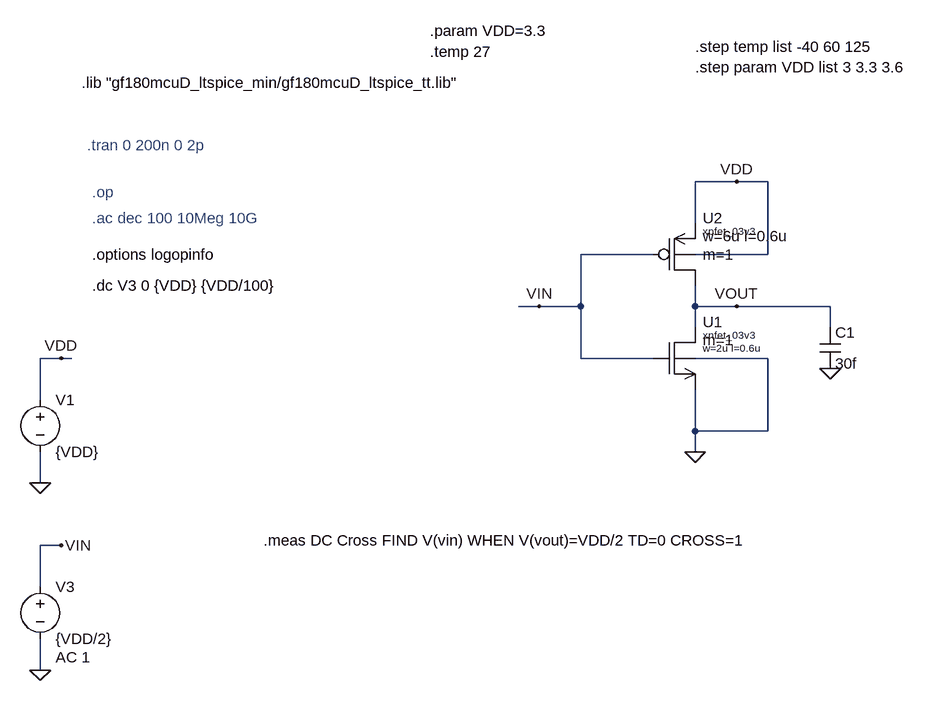
[diagram p0: schematic inv_dc_PVT.asc]
inv_dc_PVT.asc, the LTspice schematic file:
Version 4.1
SHEET 1 6080 1492
WIRE 1120 -320 1056 -320
WIRE 1168 -320 1120 -320
WIRE 1056 -256 1056 -320
WIRE 992 -208 880 -208
WIRE 1168 -208 1168 -320
WIRE 1168 -208 1056 -208
WIRE 816 -128 784 -128
WIRE 880 -128 880 -208
WIRE 880 -128 816 -128
WIRE 1056 -128 1056 -160
WIRE 1120 -128 1056 -128
WIRE 1264 -128 1120 -128
WIRE 1056 -96 1056 -128
WIRE 1264 -96 1264 -128
WIRE 80 -48 48 -48
WIRE 96 -48 80 -48
WIRE 880 -48 880 -128
WIRE 992 -48 880 -48
WIRE 1168 -48 1056 -48
WIRE 48 16 48 -48
WIRE 1056 64 1056 0
WIRE 1168 64 1168 -48
WIRE 1168 64 1056 64
WIRE 1056 96 1056 64
WIRE 48 144 48 96
WIRE 80 240 48 240
WIRE 48 304 48 240
WIRE 48 432 48 384
FLAG 80 -48 VDD
FLAG 48 144 0
FLAG 1120 -320 VDD
FLAG 1056 96 0
FLAG 80 240 VIN
FLAG 48 432 0
FLAG 1120 -128 VOUT
FLAG 816 -128 VIN
FLAG 1264 -32 0
SYMBOL voltage 48 0 R0
WINDOW 123 0 0 Left 0
WINDOW 39 0 0 Left 0
SYMATTR InstName V1
SYMATTR Value {VDD}
SYMBOL xnch 1008 -96 R0
WINDOW 123 60 20 Left 2
SYMATTR Value2 m=1
SYMATTR InstName U1
SYMATTR Value w=2u l=0.6u
SYMATTR SpiceModel xnfet_03v3
SYMBOL xpch 1008 -256 R0
WINDOW 3 60 20 Left 2
WINDOW 123 60 48 Left 2
SYMATTR Value w=6u l=0.6u
SYMATTR Value2 m=1
SYMATTR InstName U2
SYMATTR SpiceModel xpfet_03v3
SYMBOL voltage 48 288 R0
WINDOW 123 24 124 Left 2
WINDOW 39 0 0 Left 0
SYMATTR Value2 AC 1
SYMATTR InstName V3
SYMATTR Value {VDD/2}
SYMBOL cap 1248 -96 R0
SYMATTR InstName C1
SYMATTR Value 30f
TEXT 128 -304 Left 2 ;.op
TEXT 648 -552 Left 2 !.param VDD=3.3
TEXT 128 -208 Left 2 !.options logopinfo
TEXT 648 -520 Left 2 !.temp 27
TEXT 120 -376 Left 2 ;.tran 0 200n 0 2p
TEXT 128 -264 Left 2 ;.ac dec 100 10Meg 10G
TEXT 128 -160 Left 2 !.dc V3 0 {VDD} {VDD/100}
TEXT 392 232 Left 2 !.meas DC Cross FIND V(vin) WHEN V(vout)=VDD/2 TD=0 CROSS=1
TEXT 1056 -528 Left 2 !.step temp list -40 60 125
TEXT 1056 -496 Left 2 !.step param VDD list 3 3.3 3.6
TEXT 112 -472 Left 2 !.lib "gf180mcuD_ltspice_min/gf180mcuD_ltspice_tt.lib"

The netlist it stands for:
* inv_dc_PVT.asc
V1 VDD 0 {VDD}
X§U1 VOUT VIN 0 0 xnfet_03v3 w=2u l=0.6u m=1  ; pins D G S B
X§U2 VOUT VIN VDD VDD xpfet_03v3 w=6u l=0.6u m=1  ; pins D G S B
V3 VIN 0 {VDD/2} AC 1
C1 VOUT 0 30f
* .op
.param VDD=3.3
.options logopinfo
.temp 27
* .tran 0 200n 0 2p
* .ac dec 100 10Meg 10G
.dc V3 0 {VDD} {VDD/100}
.meas DC Cross FIND V(vin) WHEN V(vout)=VDD/2 TD=0 CROSS=1
.step temp list -40 60 125
.step param VDD list 3 3.3 3.6
.lib "gf180mcuD_ltspice_min/gf180mcuD_ltspice_tt.lib"
.backanno
.end